# Altium project Main_Board.PrjPcb (part 3 of 44)

## Sheet PS_Config.SchDoc: PS_Config
size A3; Organization: Altium Limited; Address1: L3, 12a Rodborough Rd; Address2: Frenchs Forest; Address3: NSW; Address4: Australia 2086
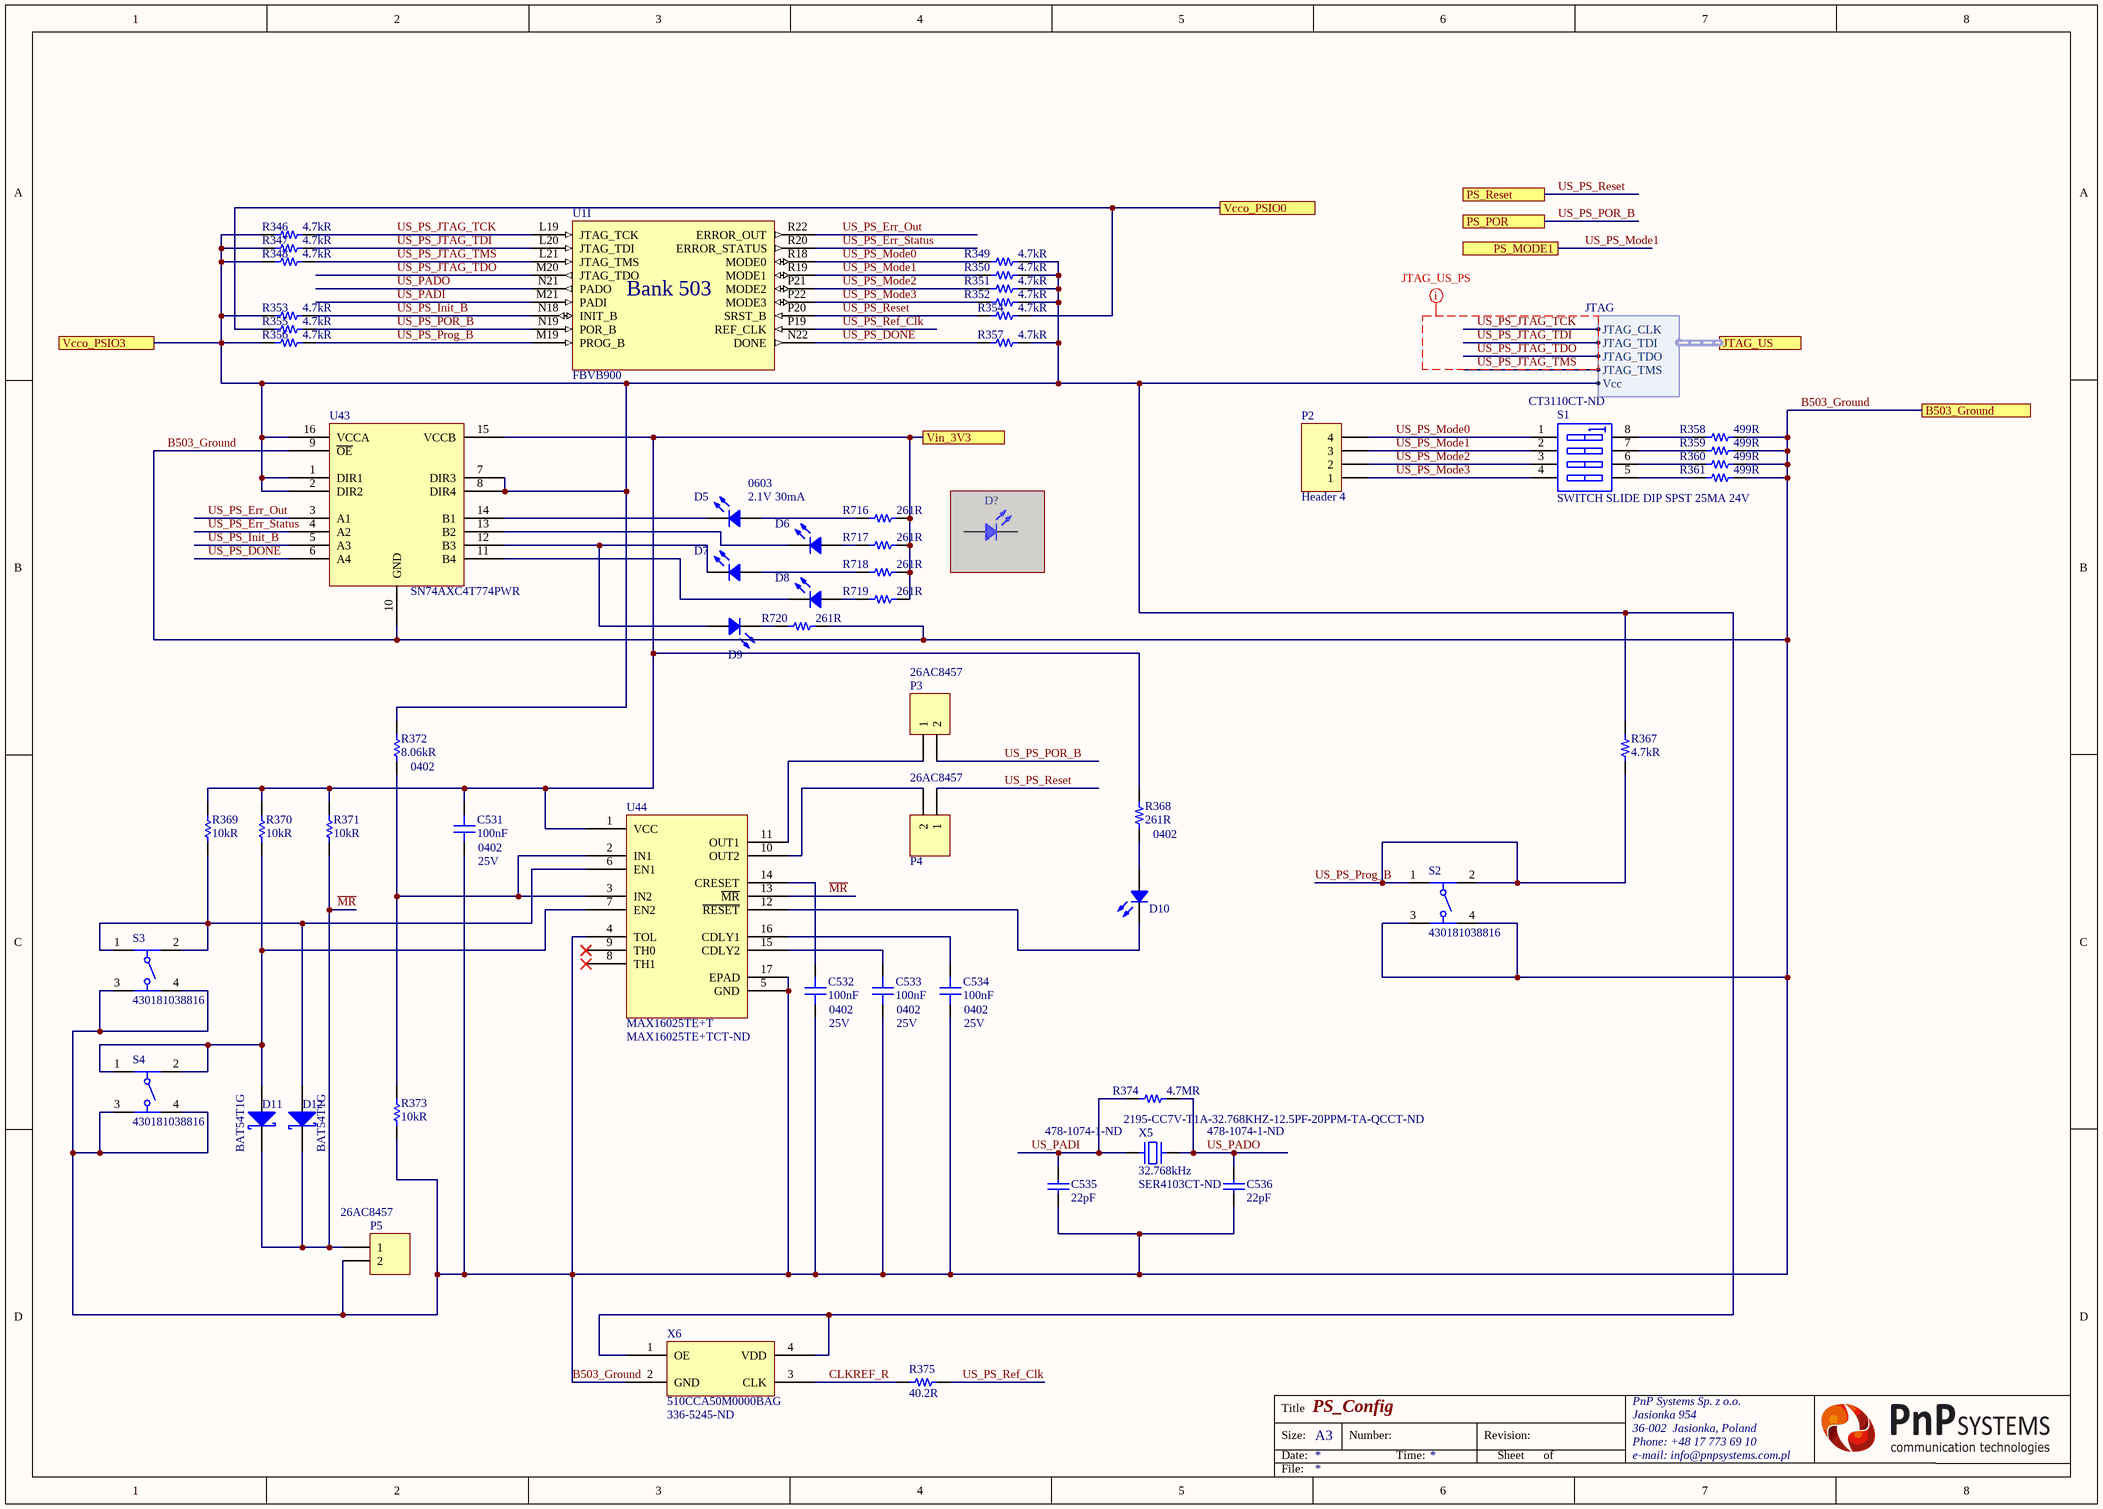
[diagram p2: PS_Config.SchDoc]

### Parts
C531  100nF  Case/Package: 0402  Voltage Rating: 25V  [CAP 0402/1005 KK]
C532  100nF  Case/Package: 0402  Voltage Rating: 25V  [CAP 0402/1005 KK]
C533  100nF  Case/Package: 0402  Voltage Rating: 25V  [CAP 0402/1005 KK]
C534  100nF  Case/Package: 0402  Voltage Rating: 25V  [CAP 0402/1005 KK]
C535  22pF  Supplier Part Number 1: 478-1074-1-ND  [CAP 0402/1005 KK]
C536  22pF  Supplier Part Number 1: 478-1074-1-ND  [CAP 0402/1005 KK]
D5  Case Code (Imperial): 0603  Forward Voltage: 2.1V  Forward Current: 30mA  [LED 0603/1608 GREEN]  (hidden comment: LTST-C190GKT)
D6  LTST-C190GKT  [LED 0603/1608 GREEN]  (value not drawn)
D7  LTST-C190GKT  [LED 0603/1608 GREEN]  (value not drawn)
D8  LTST-C190GKT  [LED 0603/1608 GREEN]  (value not drawn)
D9  LTST-C190GKT  [LED 0603/1608 GREEN]  (value not drawn)
D10  LTST-C190GKT  [LED 0603/1608 GREEN]  (value not drawn)
D11  BAT54T1G  [BAT54T1G]
D12  BAT54T1G  [BAT54T1G]
D?  LTST-C190GKT  [LED 0603/1608 GREEN]  (value not drawn)  (masked out: inside a compile mask, not in the netlist)
P2  Header 4  [HDR1X4]
P3  Supplier Part Number 1: 26AC8457  [HDR1X2]  (hidden comment: Header 2)
P4  Supplier Part Number 1: 26AC8457  [HDR1X2]  (hidden comment: Header 2)
P5  Supplier Part Number 1: 26AC8457  [HDR1X2]  (hidden comment: Header 2)
R346  4.7kR  [RES 0402/1005 RF KK]
R347  4.7kR  [RES 0402/1005 RF KK]
R348  4.7kR  [RES 0402/1005 RF KK]
R349  4.7kR  [RES 0402/1005 RF KK]
R350  4.7kR  [RES 0402/1005 RF KK]
R351  4.7kR  [RES 0402/1005 RF KK]
R352  4.7kR  [RES 0402/1005 RF KK]
R353  4.7kR  [RES 0402/1005 RF KK]
R354  4.7kR  [RES 0402/1005 RF KK]
R355  4.7kR  [RES 0402/1005 RF KK]
R356  4.7kR  [RES 0402/1005 RF KK]
R357  4.7kR  [RES 0402/1005 RF KK]
R358  499R  [RES 0402/1005 RF KK]
R359  499R  [RES 0402/1005 RF KK]
R360  499R  [RES 0402/1005 RF KK]
R361  499R  [RES 0402/1005 RF KK]
R367  4.7kR  [RES 0402/1005 RF KK]
R368  261R  Case Code (Imperial): 0402  [RES 0402/1005 RF KK]
R369  10kR  [RES 0402/1005 RF KK]
R370  10kR  [RES 0402/1005 RF KK]
R371  10kR  [RES 0402/1005 RF KK]
R372  8.06kR  Case Code (Imperial): 0402  [RES 0402/1005 RF KK]
R373  10kR  [RES 0402/1005 RF KK]
R374  4.7MR  [RES 0402/1005 RF KK]
R375  40.2R  [RES 0402/1005 RF KK]
R716  261R  [RES 0402/1005 RF KK]
R717  261R  [RES 0402/1005 RF KK]
R718  261R  [RES 0402/1005 RF KK]
R719  261R  [RES 0402/1005 RF KK]
R720  261R  [RES 0402/1005 RF KK]
S1  SWITCH SLIDE DIP SPST 25MA 24V  Supplier Part Number 1: CT3110CT-ND  [SO8_N]
S2  430181038816  [430181038816]
S3  430181038816  [430181038816]
S4  430181038816  [430181038816]
U1  FBVB900  [FBVB900 XX]  (part I of 23)
U43  SN74AXC4T774PWR  [SN74AXC4T774PWR]
U44  MAX16025TE+T  Supplier Part Number 1: MAX16025TE+TCT-ND  [MAX16025TE+T]
X5  32.768kHz  Supplier Part Number 1: SER4103CT-ND  Supplier Part Number 2: 2195-CC7V-T1A-32.768KHZ-12.5PF-20PPM-TA-QCCT-ND  [FC-135R/FC-135]
X6  510CCA50M0000BAG  Supplier Part Number 1: 336-5245-ND  [Si510]

### Ports
B503_Ground, JTAG_US (harness JTAG), PS_MODE1, PS_POR, PS_Reset, Vcco_PSIO0, Vcco_PSIO3, Vin_3V3

### Harnesses
JTAG: JTAG_CLK, JTAG_TDI, JTAG_TDO, JTAG_TMS, Vcc

### Nets
B503_Ground: C531.1 C532.1 C533.1 C534.1 C535.1 C536.1 P5.2 R358.2 R359.2 R360.2 R361.2 R373.1 R720.2 S2.3 S2.4 S3.3 S3.4 S4.3 S4.4 U43.9(~{OE}) U43.10(GND) U44.4(TOL) U44.5(GND) U44.17(EPAD) X6.2(GND) ; port B503_Ground
~{MR}: D11.1(K) D12.1(K) P5.1 R371.1 U44.13(~{MR})
CLKREF_R: R375.1 X6.3(CLK)
ETH_VDDIO: C531.2 R346.1 R347.1 R348.1 R349.2 R350.2 R351.2 R352.2 R353.1 R354.2 R355.1 R356.1 R357.2 R367.2 R368.2 R369.2 R370.2 R371.2 R372.2 R716.2 R717.2 R718.2 R719.2 U43.1(DIR1) U43.2(DIR2) U43.7(DIR3) U43.8(DIR4) U43.15(VCCB) U43.16(VCCA) U44.1(VCC) X6.1(OE) X6.4(VDD) ; port Vcco_PSIO3, port Vcco_PSIO0, port Vin_3V3, port JTAG_US.Vcc
US_PADI: C535.2 R374.1 U1.M21(PADI) X5.1
US_PADO: C536.2 R374.2 U1.N21(PADO) X5.2
US_PS_DONE: R357.1 U1.N22(DONE) U43.6(A4)
US_PS_Err_Out: U1.R22(ERROR_OUT) U43.3(A1)
US_PS_Err_Status: U1.R20(ERROR_STATUS) U43.4(A2)
US_PS_Init_B: R353.2 U1.N18(INIT_B) U43.5(A3)
US_PS_JTAG_TCK: R346.2 U1.L19(JTAG_TCK) ; port JTAG_US.JTAG_CLK
US_PS_JTAG_TDI: R347.2 U1.L20(JTAG_TDI) ; port JTAG_US.JTAG_TDI
US_PS_JTAG_TDO: U1.M20(JTAG_TDO) ; port JTAG_US.JTAG_TDO
US_PS_JTAG_TMS: R348.2 U1.L21(JTAG_TMS) ; port JTAG_US.JTAG_TMS
US_PS_Mode0: P2.4 R349.1 S1.1(A1) U1.R18(MODE0)
US_PS_Mode1: P2.3 R350.1 S1.2(A2) U1.R19(MODE1) ; port PS_MODE1  [project net PS_MODE1]
US_PS_Mode2: P2.2 R351.1 S1.3(A3) U1.P21(MODE2)
US_PS_Mode3: P2.1 R352.1 S1.4(A4) U1.P22(MODE3)
US_PS_POR_B: P3.2 R355.2 U1.N19(POR_B) ; port PS_POR  [project net PS_POR]
US_PS_Prog_B: R356.2 R367.1 S2.1 S2.2 U1.M19(PROG_B)
US_PS_Ref_Clk: R375.2 U1.P19(REF_CLK)
US_PS_Reset: P4.1 R354.1 U1.P20(SRST_B) ; port PS_Reset  [project net PS_Reset]
NetC532_2: C532.2 U44.14(CRESET)
NetC533_2: C533.2 U44.15(CDLY2)
NetC534_2: C534.2 U44.16(CDLY1)
NetD5_1: D5.1 R716.1
NetD5_2: D5.2 U43.14(B1)
NetD6_1: D6.1 R717.1
NetD6_2: D6.2 U43.13(B2)
NetD7_1: D7.1 R718.1
NetD7_2: D7.2 D9.1 U43.12(B3)
NetD8_1: D8.1 R719.1
NetD8_2: D8.2 U43.11(B4)
NetD9_2: D9.2 R720.1
NetD10_1: D10.1 R368.1
NetD10_2: D10.2 U44.12(~{RESET})
NetD11_2: D11.2(A) R370.1 S4.1 S4.2 U44.7(EN2)
NetD12_2: D12.2(A) R369.1 S3.1 S3.2 U44.6(EN1)
NetP3_1: P3.1 U44.11(OUT1)
NetP4_2: P4.2 U44.10(OUT2)
NetR358_1: R358.1 S1.8(B1)
NetR359_1: R359.1 S1.7(B2)
NetR360_1: R360.1 S1.6(B3)
NetR361_1: R361.1 S1.5(B4)
NetR372_1: R372.1 R373.2 U44.2(IN1) U44.3(IN2)

Not connected (* = marked no-connect by the designer): U44 8(TH1)* 9(TH0)*

### Layout directives
net class JTAG_US_PS: US_PS_JTAG_TCK, US_PS_JTAG_TDI, US_PS_JTAG_TDO, US_PS_JTAG_TMS

### Notes on the sheet
- Title
- Size:
- Date:
- A3
- Number:
- Time:
- Revision:
- Sheet
- of
- File:
- (in symbol FBVB900, part I) Bank 503

### Library data of the parts
C531-C534 = Capacitor: Manufacturer: Murata; Manufacturer Part Number: GRM155R71E104KE14J; Tolerance: 10%; Dielectric: X7R; Supplier 1: Digi-Key; Supplier Part Number 1: 490-14603-1-ND; Stock 1: 89275; Pricing 1: 1 = 0,10000, 10 = 0,03400, 100 = 0,01520, 500 = 0,01088, 1000 = 0,00855, 2500 = 0,00778, 5000 = 0,00715 (USD); RoHS: Yes; Mount: Surface Mount; Weight: 0.000212oz; Case Code (Imperial): 0402; Case Code (Metric): 1005; Min Operating Temperature: -55°C; Max Operating Temperature: 125°C; Packaging: Tape and Reel; Capacitance: 100nF; Termination: SMD/SMT; Composition: Ceramic; Voltage Rating (DC): 25V; Package Quantity: 50000; Length: 0.039inch; Height: 0.5mm; Width: 0.5mm; Thickness: 0.022inch; ComponentLink1URL: http://www.mouser.com/ds/2/281/c02e-2905.pdf?src-supplier=Mouser; ComponentLink1Description: http://www.mouser.com/ds/2/281/c02e-2905.pdf?src-supplier=Mouser; ComponentLink2URL: http://search.murata.co.jp/Ceramy/image/img/A01X/G101/ENG/GRM155R71E104KE14-01.pdf?src-supplier=Digi-Key; ComponentLink2Description: http://search.murata.co.jp/Ceramy/image/img/A01X/G101/ENG/GRM155R71E104KE14-01.pdf?src-supplier=Digi-Key
C535 C536 = Capacitor: Manufacturer: Kyocera AVX; Manufacturer Part Number: 04025A220JAT2A; Tolerance: 5%; Voltage Rating: 50V; Dielectric: C0G; Temperature Coefficient: 30ppm/°C; Supplier 1: Digi-Key; Stock 1: 1489814; Pricing 1: 1 = 0,10000, 10 = 0,03500, 100 = 0,01550, 500 = 0,01108, 1000 = 0,00871, 2500 = 0,00792, 5000 = 0,00729 (USD); RoHS: Yes; Mount: Surface Mount; Case/Package: 0402; Number of Pins: 2; Case Code (Metric): 1005; Case Code (Imperial): 0402; Contact Plating: Tin,Matte; Min Operating Temperature: -55°C; Max Operating Temperature: 125°C; Capacitance: 22pF; Packaging: Tape and Reel; Voltage Rating (DC): 50V; Package Quantity: 1; Termination: SMD/SMT; Voltage: 50V; Length: 1mm; Height: 0.5mm; Width: 0.02inch; Depth: 0.5mm; Thickness: 0.022inch; Radiation Hardening: No; Lead Free: Lead Free; REACH SVHC: No SVHC; ComponentLink1URL: https://datasheet.ciiva.com/11787/0900766b80def0e2-11787300.pdf?src-supplier=RSComponents; ComponentLink1Description: https://datasheet.ciiva.com/11787/0900766b80def0e2-11787300.pdf?src-supplier=RSComponents; ComponentLink2URL: https://datasheet.ciiva.com/39121/2009578-39121644.pdf?src-supplier=Jameco; ComponentLink2Description: https://datasheet.ciiva.com/39121/2009578-39121644.pdf?src-supplier=Jameco; ComponentLink3URL: https://datasheet.ciiva.com/1123/ccog-1123585.pdf?src-supplier=Element14; ComponentLink3Description: https://datasheet.ciiva.com/1123/ccog-1123585.pdf?src-supplier=Element14; ComponentLink4URL: https://datasheet.ciiva.com/1123/ccog-1123586.pdf?src-supplier=Element14; ComponentLink4Description: https://datasheet.ciiva.com/1123/ccog-1123586.pdf?src-supplier=Element14; ComponentLink5URL: https://datasheet.ciiva.com/150/ccog-150515.pdf?src-supplier=Digi-Key; ComponentLink5Description: https://datasheet.ciiva.com/150/ccog-150515.pdf?src-supplier=Digi-Key; ComponentLink6URL: https://datasheet.ciiva.com/150/ccog-150516.pdf?src-supplier=Digi-Key; ComponentLink6Description: https://datasheet.ciiva.com/150/ccog-150516.pdf?src-supplier=Digi-Key; ComponentLink7URL: https://datasheet.ciiva.com/150/ccog-150517.pdf?src-supplier=Digi-Key; ComponentLink7Description: https://datasheet.ciiva.com/150/ccog-150517.pdf?src-supplier=Digi-Key; ComponentLink8URL: https://datasheet.ciiva.com/2987/ccog-2987653.pdf?src-supplier=Avnet; ComponentLink8Description: https://datasheet.ciiva.com/2987/ccog-2987653.pdf?src-supplier=Avnet; ComponentLink9URL: https://datasheet.ciiva.com/2987/ccog-2987654.pdf?src-supplier=Avnet; ComponentLink9Description: https://datasheet.ciiva.com/2987/ccog-2987654.pdf?src-supplier=Avnet; ComponentLink10URL: https://datasheet.ciiva.com/5423/ccog-243403-5423927.pdf?src-supplier=Mouser; ComponentLink10Description: https://datasheet.ciiva.com/5423/ccog-243403-5423927.pdf?src-supplier=Mouser; ComponentLink11URL: https://datasheet.ciiva.com/16218/ccog-16218185.pdf?src-supplier=Future+Electronics; ComponentLink11Description: https://datasheet.ciiva.com/16218/ccog-16218185.pdf?src-supplier=Future+Electronics; ComponentLink12URL: https://datasheet.ciiva.com/28592/759117-28592746.pdf?src-supplier=Element14; ComponentLink12Description: https://datasheet.ciiva.com/28592/759117-28592746.pdf?src-supplier=Element14; ComponentLink13URL: https://datasheet.ciiva.com/15165/getdatasheetpartid-38041-15165131.pdf?src-supplier=Verical; ComponentLink13Description: https://datasheet.ciiva.com/15165/getdatasheetpartid-38041-15165131.pdf?src-supplier=Verical
D5 = LTST-C190GKT: LED,  LTST-C190GKT; Manufacturer 1: Vishay Lite-On; Color: Green; Lens Color: Colorless; Luminous Intensity: 6mcd; Viewing Angle: 130°; Lens Style: Clear,Diffused,Colorless,Rectangular; Power Rating: 100mW; Dominant Wavelength: 569nm; Test Current: 10mA; Lens Transparency: Clear; Number of Elements: 1; Wavelength: 565nm; Voltage: 2V; Reverse Voltage: 5V; Supplier 1: Digi-Key; Manufacturer Part Number 1: LTST-C190GKT; Stock 1: 908158; Pricing 1: 1=0.26000, 10=0.18800, 100=0.08880, 500=0.05922, 1000=0.04639 (USD); RoHS: Yes; Mount: Surface Mount; Case/Package: 0603; Number of Pins: 2; Case Code (Metric): 1608; Min Operating Temperature: -55°C; Max Operating Temperature: 85°C; Package Quantity: 1; Packaging: Tape and Reel; Illumination Color: Green; Power Dissipation: 100mW; Number of LEDs: 1; Length: 1.6mm; Height: 0.8mm; Width: 0.8mm; Depth: 0.8mm; Radiation Hardening: No; Lead Free: Lead Free; ComponentLink1URL: https://datasheet.ciiva.com/11775/0900766b80dc02a6-11775616.pdf?src-supplier=RSComponents; ComponentLink1Description: https://datasheet.ciiva.com/11775/0900766b80dc02a6-11775616.pdf?src-supplier=RSComponents; ComponentLink2URL: https://datasheet.ciiva.com/2109/ltst-c190gkt-2109985.pdf?src-supplier=Digi-Key; ComponentLink2Description: https://datasheet.ciiva.com/2109/ltst-c190gkt-2109985.pdf?src-supplier=Digi-Key; ComponentLink3URL: https://datasheet.ciiva.com/16392/lite-on20ltst-c190gkt-16392818.pdf?src-supplier=Future+Electronics; ComponentLink3Description: https://datasheet.ciiva.com/16392/lite-on20ltst-c190gkt-16392818.pdf?src-supplier=Future+Electronics; ComponentLink4URL: https://datasheet.ciiva.com/12403/lite-on-ltst-c190gkt-187204-12403884.pdf?src-supplier=Mouser; ComponentLink4Description: https://datasheet.ciiva.com/12403/lite-on-ltst-c190gkt-187204-12403884.pdf?src-supplier=Mouser; ComponentLink5URL: https://datasheet.ciiva.com/2109/ltst-c190gkt-2109986.pdf?src-supplier=Digi-Key; ComponentLink5Description: https://datasheet.ciiva.com/2109/ltst-c190gkt-2109986.pdf?src-supplier=Digi-Key; ComponentLink6URL: https://datasheet.ciiva.com/2109/ltst-c190gkt-2109987.pdf?src-supplier=Digi-Key; ComponentLink6Description: https://datasheet.ciiva.com/2109/ltst-c190gkt-2109987.pdf?src-supplier=Digi-Key; Supplier Part Number 1: 160-1183-1-ND
D6-D10 D? = LTST-C190GKT: LED,  LTST-C190GKT; Manufacturer 1: Vishay Lite-On; Color: Green; Lens Color: Colorless; Luminous Intensity: 6mcd; Forward Voltage: 2.1V; Viewing Angle: 130°; Lens Style: Clear,Diffused,Colorless,Rectangular; Forward Current: 30mA; Power Rating: 100mW; Dominant Wavelength: 569nm; Test Current: 10mA; Lens Transparency: Clear; Number of Elements: 1; Wavelength: 565nm; Voltage: 2V; Reverse Voltage: 5V; Supplier 1: Digi-Key; Manufacturer Part Number 1: LTST-C190GKT; Stock 1: 908158; Pricing 1: 1=0.26000, 10=0.18800, 100=0.08880, 500=0.05922, 1000=0.04639 (USD); RoHS: Yes; Mount: Surface Mount; Case/Package: 0603; Number of Pins: 2; Case Code (Metric): 1608; Case Code (Imperial): 0603; Min Operating Temperature: -55°C; Max Operating Temperature: 85°C; Package Quantity: 1; Packaging: Tape and Reel; Illumination Color: Green; Power Dissipation: 100mW; Number of LEDs: 1; Length: 1.6mm; Height: 0.8mm; Width: 0.8mm; Depth: 0.8mm; Radiation Hardening: No; Lead Free: Lead Free; ComponentLink1URL: https://datasheet.ciiva.com/11775/0900766b80dc02a6-11775616.pdf?src-supplier=RSComponents; ComponentLink1Description: https://datasheet.ciiva.com/11775/0900766b80dc02a6-11775616.pdf?src-supplier=RSComponents; ComponentLink2URL: https://datasheet.ciiva.com/2109/ltst-c190gkt-2109985.pdf?src-supplier=Digi-Key; ComponentLink2Description: https://datasheet.ciiva.com/2109/ltst-c190gkt-2109985.pdf?src-supplier=Digi-Key; ComponentLink3URL: https://datasheet.ciiva.com/16392/lite-on20ltst-c190gkt-16392818.pdf?src-supplier=Future+Electronics; ComponentLink3Description: https://datasheet.ciiva.com/16392/lite-on20ltst-c190gkt-16392818.pdf?src-supplier=Future+Electronics; ComponentLink4URL: https://datasheet.ciiva.com/12403/lite-on-ltst-c190gkt-187204-12403884.pdf?src-supplier=Mouser; ComponentLink4Description: https://datasheet.ciiva.com/12403/lite-on-ltst-c190gkt-187204-12403884.pdf?src-supplier=Mouser; ComponentLink5URL: https://datasheet.ciiva.com/2109/ltst-c190gkt-2109986.pdf?src-supplier=Digi-Key; ComponentLink5Description: https://datasheet.ciiva.com/2109/ltst-c190gkt-2109986.pdf?src-supplier=Digi-Key; ComponentLink6URL: https://datasheet.ciiva.com/2109/ltst-c190gkt-2109987.pdf?src-supplier=Digi-Key; ComponentLink6Description: https://datasheet.ciiva.com/2109/ltst-c190gkt-2109987.pdf?src-supplier=Digi-Key; Supplier Part Number 1: 160-1183-1-ND
D11 D12 = BAT54T1G: DIODE SCHOTTKY 30V 200MA SOD123; Manufacturer: ON Semiconductor; Forward Voltage: 350mV; Peak Reverse Current: 2uA; Reverse Recovery Time: 5ns; Max Forward Surge Current (Ifsm): 600mA; Element Configuration: Single; Power Dissipation: 400mW; Polarity: Standard; Capacitance: 10pF; Supplier 1: Digi-Key; Manufacturer Part Number: BAT54T1G; RoHS: Yes; Category: Rectifier Diodes; Stock 1: 20103; Pricing 1: 1=0,27000, 10=0,21700, 100=0,08880, 500=0,07410, 1000=0,05148 (USD); Case/Package: SOD-123-2; Number of Pins: 2; Contact Plating: Tin,Matte; Min Operating Temperature: -55°C; Max Operating Temperature: 125°C; Package Quantity: 3000; Forward Current: 200mA; Packaging: Tape and Reel; Average Rectified Current: 200mA; Max Repetitive Reverse Voltage (Vrrm): 30V; Max Reverse Voltage (DC): 30V; Max Surge Current: 600mA; Recovery Time: 5ns; Max Reverse Leakage Current: 2uA; Peak Non-Repetitive Surge Current: 600mA; Termination: SMD/SMT; Voltage Rating (DC): 30V; Current Rating: 200mA; Output Current: 200mA; Length: 2.69mm; Height: 1.12mm; Width: 1.6mm; Radiation Hardening: No; Lead Free: Lead Free; REACH SVHC: No SVHC; ComponentLink1URL: https://datasheet.ciiva.com/915/bat54t1-d-915482.pdf?src-supplier=Farnell; ComponentLink1Description: https://datasheet.ciiva.com/915/bat54t1-d-915482.pdf?src-supplier=Farnell; ComponentLink2URL: https://datasheet.ciiva.com/915/bat54t1-d-915482.pdf?src-supplier=Digi-Key; ComponentLink2Description: https://datasheet.ciiva.com/915/bat54t1-d-915482.pdf?src-supplier=Digi-Key; ComponentLink3URL: https://datasheet.ciiva.com/4714/bat54t1-d-108887-4714899.pdf?src-supplier=Mouser; ComponentLink3Description: https://datasheet.ciiva.com/4714/bat54t1-d-108887-4714899.pdf?src-supplier=Mouser; ComponentLink4URL: https://datasheet.ciiva.com/15144/getdatasheetpartid-39113-15144061.pdf?src-supplier=Verical; ComponentLink4Description: https://datasheet.ciiva.com/15144/getdatasheetpartid-39113-15144061.pdf?src-supplier=Verical; ComponentLink5URL: https://datasheet.ciiva.com/1180/bat54t1-d-1180308.pdf?src-supplier=Element14; ComponentLink5Description: https://datasheet.ciiva.com/1180/bat54t1-d-1180308.pdf?src-supplier=Element14; ComponentLink6URL: https://datasheet.ciiva.com/8299/bat54t1-d-8299989.pdf?src-supplier=Avnet; ComponentLink6Description: https://datasheet.ciiva.com/8299/bat54t1-d-8299989.pdf?src-supplier=Avnet; ComponentLink7URL: https://datasheet.ciiva.com/16475/bat54t1-d-16475623.pdf?src-supplier=Avnet+Asia; ComponentLink7Description: https://datasheet.ciiva.com/16475/bat54t1-d-16475623.pdf?src-supplier=Avnet+Asia; ComponentLink8URL: https://datasheet.ciiva.com/25950/bat54t1-d-25950154.pdf?src-supplier=Avnet+Europe; ComponentLink8Description: https://datasheet.ciiva.com/25950/bat54t1-d-25950154.pdf?src-supplier=Avnet+Europe; ComponentLink9URL: https://datasheet.ciiva.com/915/bat54t1-d-915483.pdf?src-supplier=Digi-Key; ComponentLink9Description: https://datasheet.ciiva.com/915/bat54t1-d-915483.pdf?src-supplier=Digi-Key; ComponentLink10URL: https://datasheet.ciiva.com/915/bat54t1-d-915484.pdf?src-supplier=Digi-Key; ComponentLink10Description: https://datasheet.ciiva.com/915/bat54t1-d-915484.pdf?src-supplier=Digi-Key; Supplier Part Number 1: BAT54T1GOSCT-ND
P2 = Header 4: Header, 4-Pin; LatestRevisionDate: 17-Jul-2002; LatestRevisionNote: Re-released for DXP Platform.; Publisher: Altium Limited
P3-P5 = Header 2: 00000005000HDR ASSY F/L SQ STR; Manufacturer: TE Connectivity; Manufacturer Part Number: 640456-2; Connector Type: Connector,Pin,Plug,Header; Shrouded: No (Without); Contact Current Rating: 5A; Connector System: Wire-to-Board; Plating Thickness: 3.81um; PCB Mount Retention: Without; Contact Resistance: 6mR; Max Voltage Rating (AC): 250V; Number of Positions: 2; Gender: Male; Contact Style: Straight; Mating Connector Lock: Yes (With); PCB Mounting Orientation: Vertical; Circuit Application: Signal; Pitch: 2.54mm; PCB Thickness: 0.063inch; Tail Length: 0.14inch; Contact Post Length: 3.56mm; Approvals: CSA; LatestRevisionDate: 17-Jul-2002; LatestRevisionNote: Re-released for DXP Platform.; Publisher: Altium Limited; Supplier 1: Newark; RoHS: Yes; Category: Headers and Wire Housings; Pricing 1: 1=0,11200, 10=0,08100, 25=0,07600, 100=0,06900, 500=0,05800, 1000=0,05100, 2500=0,04700 (USD); Mount: Through Hole; Color: Natural,White,Beige; Contact Plating: Tin; Contact Material: Copper Alloy; Housing Material: Polyester; Housing Color: Natural; Contact Shape: Square; Min Operating Temperature: -67°C; Max Operating Temperature: 221°C; Package Quantity: 5000; Packaging: Bulk; Termination: Solder; Number of Rows: 1; Backwall/Post Interruptions: No (Without); Fastening Type: Friction; Contact Retention: No (Without); Mating Alignment: No (Without); Mating Retention: No (Without); PCB Mount Alignment: No (Without); Sealable: No (Without); Strain Relief: No (Without); Contact Gender: Male; Voltage Rating (AC): 250V; Orientation: Straight; Number of Contacts: 2; Current Rating: 5A; Mounting Ears: No (Without); Number of Poles: 2; Panel Mount Retention: No (Without); Voltage Rating: 250V; Working Voltage: 250V; Length: 7.62mm; Height: 7.87mm; Depth: 5.72mm; Lead Pitch: 2.54mm; Contact Mating Length: 7.49mm; Radiation Hardening: No; ELV: Compliant; Lead Free: Lead Free; Flammability Rating: UL94 V-0; REACH SVHC: No SVHC; ComponentLink1URL: https://datasheet.ciiva.com/709/eng-cd-640456-w1-709680.pdf?src-supplier=Digi-Key; ComponentLink1Description: https://datasheet.ciiva.com/709/eng-cd-640456-w1-709680.pdf?src-supplier=Digi-Key; ComponentLink2URL: https://datasheet.ciiva.com/3118/eng-ds-82056-mta-0608-3118497.pdf?src-supplier=Avnet; ComponentLink2Description: https://datasheet.ciiva.com/3118/eng-ds-82056-mta-0608-3118497.pdf?src-supplier=Avnet; ComponentLink3URL: https://datasheet.ciiva.com/14156/04384301-14156820.pdf?src-supplier=Distrelec; ComponentLink3Description: https://datasheet.ciiva.com/14156/04384301-14156820.pdf?src-supplier=Distrelec; ComponentLink4URL: https://datasheet.ciiva.com/16401/eng-ds-82056-mta-0608-16401289.pdf?src-supplier=Future+Electronics; ComponentLink4Description: https://datasheet.ciiva.com/16401/eng-ds-82056-mta-0608-16401289.pdf?src-supplier=Future+Electronics; ComponentLink5URL: https://datasheet.ciiva.com/25617/0900766b80027008-25617244.pdf?src-supplier=RSComponents; ComponentLink5Description: https://datasheet.ciiva.com/25617/0900766b80027008-25617244.pdf?src-supplier=RSComponents; ComponentLink6URL: https://datasheet.ciiva.com/11746/0900766b80eb7fdd-11746365.pdf?src-supplier=RSComponents; ComponentLink6Description: https://datasheet.ciiva.com/11746/0900766b80eb7fdd-11746365.pdf?src-supplier=RSComponents; ComponentLink7URL: https://datasheet.ciiva.com/7128/1866390-7128742.pdf?src-supplier=Newark; ComponentLink7Description: https://datasheet.ciiva.com/7128/1866390-7128742.pdf?src-supplier=Newark; ComponentLink8URL: https://datasheet.ciiva.com/16505/eng-ds-82056-mta-0608-16505419.pdf?src-supplier=Avnet+Asia; ComponentLink8Description: https://datasheet.ciiva.com/16505/eng-ds-82056-mta-0608-16505419.pdf?src-supplier=Avnet+Asia
R346-R357 R367 = Resistor: as R83 on sheet Ultrascale+_01; Supplier 1: Digi-Key; Supplier Part Number 1: P4.70KLCT-ND; Stock 1: 5361977; Pricing 1: 1 = 0,10000, 10 = 0,05500, 100 = 0,02250, 1000 = 0,01009, 2500 = 0,00876, 5000 = 0,00724 (USD); RoHS: Yes; Mount: Surface Mount; Case/Package: 0402; Number of Pins: 2; Case Code (Imperial): 0402; Case Code (Metric): 1005; Contact Plating: Tin; Min Operating Temperature: -55°C; Max Operating Temperature: 155°C; Resistance: 4.7kR; Packaging: Tape and Reel; Composition: Thick Film; Package Quantity: 1; Termination: SMD/SMT; Voltage Rating (DC): 50V; Number of Terminations: 2; Military Standard: Not; Max Power Dissipation: 100mW; Features: Automotive AEC-Q200; Length: 1mm; Height: 0.35mm; Width: 0.02inch; Depth: 0.5mm; Radiation Hardening: No; Lead Free: Lead Free; REACH SVHC: No SVHC; ComponentLink1URL: https://datasheet.ciiva.com/11821/0900766b80f80784-11821329.pdf?src-supplier=RSComponents; ComponentLink1Description: https://datasheet.ciiva.com/11821/0900766b80f80784-11821329.pdf?src-supplier=RSComponents; ComponentLink2URL: https://datasheet.ciiva.com/30053/aoa0000ce2-30053990.pdf?src-supplier=Onlinecomponents.com; ComponentLink2Description: https://datasheet.ciiva.com/30053/aoa0000ce2-30053990.pdf?src-supplier=Onlinecomponents.com; ComponentLink3URL: https://datasheet.ciiva.com/7830/aoa0000ce2-7830727.pdf?src-supplier=Element14; ComponentLink3Description: https://datasheet.ciiva.com/7830/aoa0000ce2-7830727.pdf?src-supplier=Element14; ComponentLink4URL: https://datasheet.ciiva.com/22781/1678782-22781576.pdf?src-supplier=Farnell; ComponentLink4Description: https://datasheet.ciiva.com/22781/1678782-22781576.pdf?src-supplier=Farnell; ComponentLink5URL: https://datasheet.ciiva.com/9195/aoa0000ce2-9195737.pdf?src-supplier=Avnet; ComponentLink5Description: https://datasheet.ciiva.com/9195/aoa0000ce2-9195737.pdf?src-supplier=Avnet; ComponentLink6URL: https://datasheet.ciiva.com/17213/aoa0000ce2-17213180.pdf?src-supplier=Avnet+Europe; ComponentLink6Description: https://datasheet.ciiva.com/17213/aoa0000ce2-17213180.pdf?src-supplier=Avnet+Europe; ComponentLink7URL: https://datasheet.ciiva.com/22667/1678782-22667886.pdf?src-supplier=Element14; ComponentLink7Description: https://datasheet.ciiva.com/22667/1678782-22667886.pdf?src-supplier=Element14; ComponentLink8URL: https://datasheet.ciiva.com/16763/70260748-16763151.pdf?src-supplier=Allied+Electronics; ComponentLink8Description: https://datasheet.ciiva.com/16763/70260748-16763151.pdf?src-supplier=Allied+Electronics; ComponentLink9URL: https://datasheet.ciiva.com/22723/1678782-22723903.pdf?src-supplier=Element14; ComponentLink9Description: https://datasheet.ciiva.com/22723/1678782-22723903.pdf?src-supplier=Element14; ComponentLink10URL: https://datasheet.ciiva.com/24025/aoa0000ce2-24025663.pdf?src-supplier=Mouser; ComponentLink10Description: https://datasheet.ciiva.com/24025/aoa0000ce2-24025663.pdf?src-supplier=Mouser
R358-R361 = Resistor: Resistor;  Thick Film;  Res 499 Ohms;  Pwr-Rtg 0.1 W;  Tol 1%;  SMT;  0402;  Tape & Reel; Manufacturer: Panasonic; Manufacturer Part Number: ERJ-2RKF4990X; Power Rating: 100mW; Voltage Rating: 50V; Temperature Coefficient: 100ppm/°C; Supplier 1: Digi-Key; Supplier Part Number 1: P499LCT-ND; RoHS: Yes; Category: Chip SMD Resistors; Stock 1: 4560116; Pricing 1: 1=0,10000, 10=0,04100, 100=0,01670, 1000=0,00751, 2500=0,00652, 5000=0,00538 (USD); Mount: Surface Mount; Case/Package: 0402; Case Code (Metric): 1005; Case Code (Imperial): 0402; Contact Plating: Tin; Min Operating Temperature: -55°C; Max Operating Temperature: 155°C; Resistance: 499R; Tolerance: 1%; Packaging: Tape and Reel; Package Quantity: 1; Composition: Thick Film; Number of Terminations: 2; Termination: SMD/SMT; Military Standard: Not; Max Power Dissipation: 100mW; Voltage Rating (DC): 50V; Features: Automotive AEC-Q200; Length: 1mm; Height: 0.35mm; Width: 0.02inch; Depth: 0.5mm; REACH SVHC: No SVHC; Lead Free: Lead Free; ComponentLink1URL: https://datasheet.ciiva.com/9181/aoa0000ce2-9181461.pdf?src-supplier=Avnet; ComponentLink1Description: https://datasheet.ciiva.com/9181/aoa0000ce2-9181461.pdf?src-supplier=Avnet; ComponentLink2URL: https://datasheet.ciiva.com/28695/1678782-28695781.pdf?src-supplier=Element14; ComponentLink2Description: https://datasheet.ciiva.com/28695/1678782-28695781.pdf?src-supplier=Element14; ComponentLink3URL: https://datasheet.ciiva.com/6201/426256-6201373.pdf?src-supplier=Farnell; ComponentLink3Description: https://datasheet.ciiva.com/6201/426256-6201373.pdf?src-supplier=Farnell; ComponentLink4URL: https://datasheet.ciiva.com/16508/aoa0000ce2-16508382.pdf?src-supplier=Future+Electronics; ComponentLink4Description: https://datasheet.ciiva.com/16508/aoa0000ce2-16508382.pdf?src-supplier=Future+Electronics; ComponentLink5URL: https://datasheet.ciiva.com/16765/70260748-16765054.pdf?src-supplier=Allied+Electronics; ComponentLink5Description: https://datasheet.ciiva.com/16765/70260748-16765054.pdf?src-supplier=Allied+Electronics; ComponentLink6URL: https://datasheet.ciiva.com/22749/1678782-22749610.pdf?src-supplier=Element14; ComponentLink6Description: https://datasheet.ciiva.com/22749/1678782-22749610.pdf?src-supplier=Element14; ComponentLink7URL: https://datasheet.ciiva.com/46377/426256-46377550.pdf?src-supplier=Element14; ComponentLink7Description: https://datasheet.ciiva.com/46377/426256-46377550.pdf?src-supplier=Element14
R368 R716-R720 = Resistor: Thick Film Resistors 0402 261ohms 1% AEC-Q200; Manufacturer: Panasonic; Manufacturer Part Number: ERJ-2RKF2610X; Power Rating: 100mW; Voltage Rating: 50V; Temperature Coefficient: 100ppm/°C; Supplier 1: Digi-Key; Supplier Part Number 1: P261LCT-ND; RoHS: Yes; Category: Chip SMD Resistors; Stock 1: 1010472; Pricing 1: 1=0,10000, 10=0,04100, 100=0,01670, 1000=0,00751, 2500=0,00652, 5000=0,00538 (USD); Mount: Surface Mount; Case/Package: 0402; Weight: 2.8E-05oz; Case Code (Metric): 1005; Contact Plating: Tin; Min Operating Temperature: -55°C; Max Operating Temperature: 155°C; Resistance: 261R; Tolerance: 1%; Packaging: Tape and Reel; Package Quantity: 1; Composition: Thick Film; Number of Terminations: 2; Termination: SMD/SMT; Military Standard: Not; Max Power Dissipation: 100mW; Voltage Rating (DC): 50V; Features: Automotive AEC-Q200; Length: 1mm; Height: 0.016inch; Width: 0.02inch; Depth: 0.5mm; REACH SVHC: No SVHC; Lead Free: Lead Free; ComponentLink1URL: https://datasheet.ciiva.com/9183/aoa0000ce2-9183704.pdf?src-supplier=Avnet; ComponentLink1Description: https://datasheet.ciiva.com/9183/aoa0000ce2-9183704.pdf?src-supplier=Avnet; ComponentLink2URL: https://datasheet.ciiva.com/22673/1678782-22673517.pdf?src-supplier=Element14; ComponentLink2Description: https://datasheet.ciiva.com/22673/1678782-22673517.pdf?src-supplier=Element14; ComponentLink3URL: https://datasheet.ciiva.com/22720/1678782-22720861.pdf?src-supplier=Farnell; ComponentLink3Description: https://datasheet.ciiva.com/22720/1678782-22720861.pdf?src-supplier=Farnell; ComponentLink4URL: https://datasheet.ciiva.com/22673/1678782-22673518.pdf?src-supplier=Element14; ComponentLink4Description: https://datasheet.ciiva.com/22673/1678782-22673518.pdf?src-supplier=Element14; ComponentLink5URL: https://datasheet.ciiva.com/7903/1678782-7903407.pdf?src-supplier=Element14; ComponentLink5Description: https://datasheet.ciiva.com/7903/1678782-7903407.pdf?src-supplier=Element14; ComponentLink6URL: https://datasheet.ciiva.com/24160/aoa0000ce2-24160255.pdf?src-supplier=Mouser; ComponentLink6Description: https://datasheet.ciiva.com/24160/aoa0000ce2-24160255.pdf?src-supplier=Mouser
  R716-R720: Case Code (Imperial): 0402
R369-R371 R373 = Resistor: Manufacturer 1: Yageo; Manufacturer Part Number 1: RC0402FR-0710KL; Tolerance: 1%; Temperature Coefficient: 100ppm/°C; Voltage Rating: 50V; Power Rating: 62.5mW; Supplier 1: Digi-Key; Supplier Part Number 1: 311-10.0KLRCT-ND; Stock 1: 71214322; Pricing 1: 1=0,10000, 10=0,01500, 100=0,00600, 1000=0,00270, 2500=0,00235, 5000=0,00194 (USD); RoHS: Yes; Case/Package: 0402; Number of Pins: 2; Case Code (Imperial): 0402; Case Code (Metric): 1005; Min Operating Temperature: -55°C; Max Operating Temperature: 155°C; Resistance: 10kR; Packaging: Tape and Reel; Composition: Thick Film; Voltage Rating (DC): 50V; Termination: SMD/SMT; Military Standard: Not; Working Voltage: 50V; Number of Terminations: 2; Length: 1mm; Height: 0.32mm; Width: 0.5mm; Depth: 0.5mm; Lead Pitch: 0.2mm; REACH SVHC: No SVHC; Lead Free: Lead Free; ComponentLink1URL: https://datasheet.ciiva.com/7660/38568-7660787.pdf?src-supplier=Element14; ComponentLink1Description: https://datasheet.ciiva.com/7660/38568-7660787.pdf?src-supplier=Element14; ComponentLink2URL: https://datasheet.ciiva.com/7849/1784430-7849813.pdf?src-supplier=Element14; ComponentLink2Description: https://datasheet.ciiva.com/7849/1784430-7849813.pdf?src-supplier=Element14; ComponentLink3URL: https://datasheet.ciiva.com/7849/1686128-7849814.pdf?src-supplier=Element14; ComponentLink3Description: https://datasheet.ciiva.com/7849/1686128-7849814.pdf?src-supplier=Element14; ComponentLink4URL: https://datasheet.ciiva.com/7849/1784430-7849815.pdf?src-supplier=Element14; ComponentLink4Description: https://datasheet.ciiva.com/7849/1784430-7849815.pdf?src-supplier=Element14; ComponentLink5URL: https://datasheet.ciiva.com/22747/1018594-22747512.pdf?src-supplier=Element14; ComponentLink5Description: https://datasheet.ciiva.com/22747/1018594-22747512.pdf?src-supplier=Element14; ComponentLink6URL: https://datasheet.ciiva.com/12667/pyu-rc0402-51-rohs-l-6-r-12667067.pdf?src-supplier=Mouser; ComponentLink6Description: https://datasheet.ciiva.com/12667/pyu-rc0402-51-rohs-l-6-r-12667067.pdf?src-supplier=Mouser; ComponentLink7URL: https://datasheet.ciiva.com/7983/1018594-7983486.pdf?src-supplier=Element14; ComponentLink7Description: https://datasheet.ciiva.com/7983/1018594-7983486.pdf?src-supplier=Element14
R372 = Resistor: RES 8.06K OHM 1% 1/16W 0402; Manufacturer: Stackpole Electronics; Manufacturer Part Number: RMCF0402FT8K06; Max Power Dissipation: 63mW; Temperature Coefficient: 100ppm/°C; Supplier 1: Digi-Key; Supplier Part Number 1: RMCF0402FT8K06CT-ND; RoHS: Yes; Category: Chip SMD Resistors; Stock 1: 148746; Pricing 1: 1=0,10000, 10=0,01400, 100=0,00580, 1000=0,00262, 2500=0,00228, 5000=0,00188 (USD); Mount: Surface Mount; Case/Package: 0402; Case Code (Metric): 1005; Contact Plating: Tin,Matte; Min Operating Temperature: -55°C; Max Operating Temperature: 155°C; Resistance: 8.06kR; Tolerance: 1%; Features: Automotive AEC-Q200; Packaging: Tape and Reel; Composition: Thick Film; Number of Terminations: 2; Length: 0.039inch; Height: 0.016inch; Width: 0.02inch; Radiation Hardening: No; Lead Free: Lead Free; ComponentLink1URL: https://www.seielect.com/catalog/SEI-RMCF_RMCP.pdf?src-supplier=Avnet; ComponentLink1Description: https://www.seielect.com/catalog/SEI-RMCF_RMCP.pdf?src-supplier=Avnet; ComponentLink2URL: https://www.seielect.com/catalog/SEI-Packaging.pdf?src-supplier=Digi-Key; ComponentLink2Description: https://www.seielect.com/catalog/SEI-Packaging.pdf?src-supplier=Digi-Key; ComponentLink3URL: https://www.seielect.com/Catalog/SEI-RMCF_RMCP.pdf?src-supplier=Digi-Key; ComponentLink3Description: https://www.seielect.com/Catalog/SEI-RMCF_RMCP.pdf?src-supplier=Digi-Key
R374 = Resistor: Thick Film Resistors 0.1W 4.7Mohms 5%; Manufacturer: KOA Speer; Manufacturer Part Number: RK73B1ETTP475J; Power Rating: 63mW; Voltage Rating: 50V; Temperature Coefficient: 200ppm/°C; Supplier 1: Digi-Key; Supplier Part Number 1: 2019-RK73B1ETTP475JCT-ND; RoHS: Yes; Category: Chip SMD Resistors; Stock 1: 88868; Pricing 1: 1=0,10000, 10=0,01600, 100=0,00650, 1000=0,00292, 2500=0,00253, 5000=0,00209 (USD); Case/Package: 0402; Case Code (Imperial): 0402; Case Code (Metric): 1005; Min Operating Temperature: -55°C; Max Operating Temperature: 155°C; Resistance: 4.7MR; Tolerance: 5%; Packaging: Tape and Reel; Package Quantity: 10000; Composition: Thick Film; Termination: SMD/SMT; Military Standard: Not; Voltage Rating (DC): 50V; Length: 1mm; Height: 0.35mm; Width: 0.5mm; Depth: 0.5mm; Lead Free: Lead Free; ComponentLink1URL: https://datasheet.ciiva.com/5554/rk73b-5554347.pdf?src-supplier=Mouser; ComponentLink1Description: https://datasheet.ciiva.com/5554/rk73b-5554347.pdf?src-supplier=Mouser; ComponentLink2URL: https://datasheet.ciiva.com/15202/getdatasheetpartid-163920-15202635.pdf?src-supplier=Verical; ComponentLink2Description: https://datasheet.ciiva.com/15202/getdatasheetpartid-163920-15202635.pdf?src-supplier=Verical
R375 = Resistor: RES SMD 40.2 OHM 1% 1/16W 0402; Manufacturer: Yageo; Manufacturer Part Number: RC0402FR-0740R2L; Temperature Coefficient: 100ppm/°C; Power Rating: 62.5mW; Voltage Rating: 50V; Max Power Dissipation: 63mW; Supplier 1: Digi-Key; Supplier Part Number 1: 311-40.2LRCT-ND; RoHS: Yes; Category: Chip SMD Resistors; Stock 1: 1509993; Pricing 1: 1=0,10000, 10=0,01600, 100=0,00640, 1000=0,00289, 2500=0,00251, 5000=0,00207 (USD); Case/Package: 0402; Contact Plating: Tin,Matte; Case Code (Metric): 1005; Case Code (Imperial): 0402; Min Operating Temperature: -55°C; Max Operating Temperature: 155°C; Resistance: 40.2R; Tolerance: 1%; Composition: Thick Film; Packaging: Tape and Reel; Package Quantity: 1; Number of Terminations: 2; Termination: SMD/SMT; Military Standard: Not; Voltage Rating (DC): 50V; Features: Moisture Resistant; Length: 1mm; Height: 0.016inch; Width: 0.02inch; Depth: 0.5mm; REACH SVHC: Unknown; Lead Free: Lead Free; ComponentLink1URL: https://datasheet.ciiva.com/2491/pyu-r-int-thick-7-2491216.pdf?src-supplier=Digi-Key; ComponentLink1Description: https://datasheet.ciiva.com/2491/pyu-r-int-thick-7-2491216.pdf?src-supplier=Digi-Key; ComponentLink2URL: https://datasheet.ciiva.com/2491/pyu-r-int-thick-7-2491218.pdf?src-supplier=Digi-Key; ComponentLink2Description: https://datasheet.ciiva.com/2491/pyu-r-int-thick-7-2491218.pdf?src-supplier=Digi-Key; ComponentLink3URL: https://datasheet.ciiva.com/16857/pyu-rc0402-51-rohs-l-6-16857079.pdf?src-supplier=Avnet+Europe; ComponentLink3Description: https://datasheet.ciiva.com/16857/pyu-rc0402-51-rohs-l-6-16857079.pdf?src-supplier=Avnet+Europe; ComponentLink4URL: https://datasheet.ciiva.com/28400/pyu-rc0402-51-rohs-l-6-28400158.pdf?src-supplier=Avnet+Europe; ComponentLink4Description: https://datasheet.ciiva.com/28400/pyu-rc0402-51-rohs-l-6-28400158.pdf?src-supplier=Avnet+Europe; ComponentLink5URL: https://datasheet.ciiva.com/2491/pyu-r-int-thick-7-2491217.pdf?src-supplier=Digi-Key; ComponentLink5Description: https://datasheet.ciiva.com/2491/pyu-r-int-thick-7-2491217.pdf?src-supplier=Digi-Key; ComponentLink6URL: https://datasheet.ciiva.com/22643/1018594-22643397.pdf?src-supplier=Element14; ComponentLink6Description: https://datasheet.ciiva.com/22643/1018594-22643397.pdf?src-supplier=Element14; ComponentLink7URL: https://datasheet.ciiva.com/17200/pyu-rc0402-51-rohs-l-6-r-17200253.pdf?src-supplier=Future+Electronics; ComponentLink7Description: https://datasheet.ciiva.com/17200/pyu-rc0402-51-rohs-l-6-r-17200253.pdf?src-supplier=Future+Electronics
S1 = SW DIP-4: Manufacturer: CTS; Manufacturer Part Number: 218-4LPSTR; Mechanical Life: 1000Cycles; Actuator Type: Slide (Standard); Number of Positions: 4; Pitch: 0.05inch; Washable: Yes; Published: 24-Mar-1999; LatestRevisionDate: 29-May-2009; LatestRevisionNote: IPC-7351 Footprint Added.; PackageVersion: Dec-2002; PackageReference: SO8; Publisher: Altium Limited; PackageDescription: 8-Pin Small Outline Integrated Circuit 1.27 mm Pitch; Code_JEDEC: MS-012-AA; Code_IPC: SOIC127P600-8; Supplier 1: Digi-Key; RoHS: Yes; Category: DIP Switches; Stock 1: 21553; Pricing 1: 1=1,33000, 10=1,28000, 25=1,20280, 100=1,03910, 250=0,94696, 500=0,88040, 1000=0,81898 (USD); Mount: Surface Mount; Contact Material: Copper; Contact Plating: Gold; Min Operating Temperature: -55°C; Max Operating Temperature: 85°C; Orientation: Straight; Packaging: Tape and Reel; Throw Configuration: SPST; Voltage Rating (DC): 24V; Package Quantity: 2000; Max Voltage Rating (DC): 24V; Max Current Rating: 25mA; Termination: Gull Wing; Current Rating: 25mA; Electrical Life: 1000Cycles; Length: 0.246inch; Depth: 8.44mm; Radiation Hardening: No; Lead Free: Lead Free; ComponentLink1URL: https://datasheet.ciiva.com/8676/218-8676896.pdf?src-supplier=Avnet; ComponentLink1Description: https://datasheet.ciiva.com/8676/218-8676896.pdf?src-supplier=Avnet; ComponentLink2URL: https://datasheet.ciiva.com/8082/218-8082342.pdf?src-supplier=Avnet; ComponentLink2Description: https://datasheet.ciiva.com/8082/218-8082342.pdf?src-supplier=Avnet; ComponentLink3URL: https://datasheet.ciiva.com/16303/218-16303941.pdf?src-supplier=Future+Electronics; ComponentLink3Description: https://datasheet.ciiva.com/16303/218-16303941.pdf?src-supplier=Future+Electronics; ComponentLink4URL: https://datasheet.ciiva.com/15184/getdatasheetpartid-141001-15184860.pdf?src-supplier=Verical; ComponentLink4Description: https://datasheet.ciiva.com/15184/getdatasheetpartid-141001-15184860.pdf?src-supplier=Verical
S2-S4 = 430181038816: WS-TASV SMT Tact Switch 4.5x4.5mm, height 3.8mm, 160gf; Rated Voltage: 12VDC; Rated Current: 50mA; Washable: No; ComponentLink1Description: Manufacturer; ComponentLink1URL: http://www.we-online.de; ComponentLink2Description: Datasheet; ComponentLink2URL: https://katalog.we-online.com/em/datasheet/430181038816.pdf; Operating Temperature: -40 to +85degC; Part Number: 430181038816; Published Date: September 2019; Contact Material: Stainless Steel; Height: 3.8mm; Mounting Technology: SMT; Contact Plating: Silver; Operation Force: 160gf; Packaging: Tape and Reel; Terminal Material: Copper Alloy; Publisher: Wurth Elektronik; Terminal Plating: Silver
U1 = FBVB900: as U1 on sheet Ultrascale+_01; Supplier 1: Mouser; Supplier Part Number 1: 217-CZU4CG-1FBVB900E; Stock 1: 3; Pricing 1: 1=0,00000, 5=1060,70000 (USD); RoHS: No; Case/Package: FCBGA; Min Operating Temperature: 0°C; Max Operating Temperature: 100°C; Packaging: Tray; ComponentLink1URL: https://www.xilinx.com/support/documentation/data_sheets/ds891-zynq-ultrascale-plus-overview.pdf?src-supplier=Digi-Key; ComponentLink1Description: https://www.xilinx.com/support/documentation/data_sheets/ds891-zynq-ultrascale-plus-overview.pdf?src-supplier=Digi-Key; ComponentLink2URL: https://www.xilinx.com/support/documentation/data_sheets/ds925-zynq-ultrascale-plus.pdf?src-supplier=Digi-Key; ComponentLink2Description: https://www.xilinx.com/support/documentation/data_sheets/ds925-zynq-ultrascale-plus.pdf?src-supplier=Digi-Key; Supplier 2: Avnet; Supplier 3: Digi-Key; Supplier Part Number 2: XCZU4CG-1FBVB900E; Supplier Part Number 3: XCZU4CG-1FBVB900E-ND
U43 = SN74AXC4T774PWR: Manufacturer 1: Texas Instruments; Supplier 1: Digi-Key; Manufacturer Part Number 1: SN74AXC4T774PWR; Stock 1: 2000; Pricing 1: 1=1,14000, 10=1,01500, 100=0,79120, 500=0,65364, 1000=0,51603 (USD); RoHS: No; Supplier Part Number 1: 296-SN74AXC4T774PWRCT-ND
U44 = MAX16025TE+T: IC SUPERVISORY CIRC DL 16TQFN; Manufacturer: Maxim; Min Supply Voltage: 2.2V; Max Supply Voltage: 28V; Max Power Dissipation: 2W; Number of Voltages Monitored: 2; Reset: Active Low; Reset Timeout: 140ms; Operating Supply Current: 52uA; Watchdog Timer: No; Supplier 1: Digi-Key; Manufacturer Part Number: MAX16025TE+T; RoHS: Yes; Category: Voltage Supervisors; Stock 1: 1731; Pricing 1: 1=4,87000, 10=3,85200, 25=3,51240, 100=3,05910, 250=2,83252 (USD); Mount: Surface Mount; Number of Pins: 16; Min Operating Temperature: -40°C; Max Operating Temperature: 125°C; Packaging: Tape and Reel; Package Quantity: 2500; Type: Sequencer; Lead Free: Lead Free; ComponentLink1URL: https://datasheet.ciiva.com/1995/max16025-max16030-1995540.pdf?src-supplier=Digi-Key; ComponentLink1Description: https://datasheet.ciiva.com/1995/max16025-max16030-1995540.pdf?src-supplier=Digi-Key; ComponentLink2URL: https://datasheet.ciiva.com/13028/max16025-max16030-43326-13028393.pdf?src-supplier=Mouser; ComponentLink2Description: https://datasheet.ciiva.com/13028/max16025-max16030-43326-13028393.pdf?src-supplier=Mouser
X5 = FC-13532.7680KA-A5: CRYSTAL 32.7680 KHZ 12.5PF SMD; Manufacturer: Epson; Frequency Tolerance: 20ppm; Series Resistance: 70kR; Supplier 1: Digi-Key; Manufacturer Part Number: FC-13532.7680KA-A5; RoHS: Yes; Category: Crystals; Stock 1: 101729; Pricing 1: 1=0,43000, 10=0,35800, 50=0,32180, 100=0,28600, 500=0,27170, 1000=0,22880 (USD); Mount: Surface Mount; Case/Package: SMD/SMT; Number of Pins: 2; Min Operating Temperature: -40°C; Max Operating Temperature: 85°C; Load Capacitance: 12.5pF; Packaging: Tape and Reel; Frequency: 32.768kHz; ESR (Equivalent Series Resistance): 70kR; Length: 0.126inch; Height: 0.035inch; Width: 0.061inch; ComponentLink1URL: https://support.epson.biz/td/api/doc_check.php?dl=brief_FC-135&lang=en&src-supplier=Digi-Key; ComponentLink1Description: https://support.epson.biz/td/api/doc_check.php?dl=brief_FC-135&lang=en&src-supplier=Digi-Key; ComponentLink2URL: https://www.eea.epson.com/wp-content/uploads/2016/11/November-2016-PCS-MASTER-BOOK.pdf?src-supplier=Digi-Key; ComponentLink2Description: https://www.eea.epson.com/wp-content/uploads/2016/11/November-2016-PCS-MASTER-BOOK.pdf?src-supplier=Digi-Key; Supplier 2: Digi-Key; Stock 2: 1608; Pricing 2: 1=0,64000, 10=0,53600, 50=0,48260, 100=0,42900, 500=0,40756 (USD)
X6 = 510CCA50M0000BAG: SMD Crystal Oscillator 50MHz 3.3V 4-Pin SMD Tray; Manufacturer: Silicon Labs; Frequency Stability: 20ppm; Supplier 1: Digi-Key; Manufacturer Part Number: 510CCA50M0000BAG; Stock 1: 247; Pricing 1: 1 = 3,26000, 25 = 3,13800, 100 = 3,01710, 1000 = 2,62163 (USD); RoHS: Yes; Case/Package: SMD/SMT; Weight: 0.001764oz; Operating Supply Voltage: 3.3V; Package Quantity: 1; Packaging: Tray; Frequency: 50MHz; Length: 5mm; Width: 3.2mm; ComponentLink1URL: https://datasheet.ciiva.com/9292/+si510-11-9292588.pdf?src-supplier=Avnet; ComponentLink1Description: https://datasheet.ciiva.com/9292/+si510-11-9292588.pdf?src-supplier=Avnet